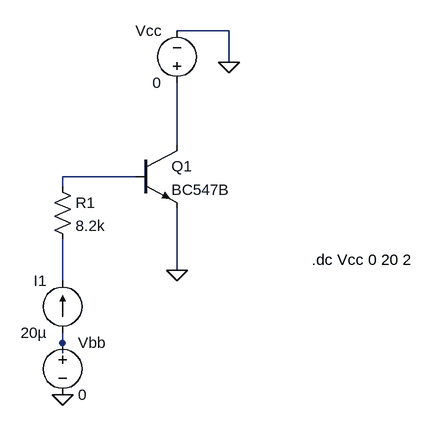
[diagram p0: schematic commonemitter.asc]
commonemitter.asc, the LTspice schematic file:
Version 4
SHEET 1 880 680
WIRE 160 -192 80 -192
WIRE 160 -144 160 -192
WIRE 80 -16 80 -112
WIRE 16 32 -96 32
WIRE -96 48 -96 32
WIRE 80 176 80 80
WIRE -96 192 -96 128
WIRE -96 288 -96 272
WIRE -96 304 -96 288
FLAG 80 176 0
FLAG 160 -144 0
FLAG -96 368 0
SYMBOL npn 16 -16 R0
SYMATTR InstName Q1
SYMATTR Value BC547B
SYMBOL res -112 32 R0
SYMATTR InstName R1
SYMATTR Value 8.2k
SYMBOL voltage 80 -96 R180
WINDOW 0 24 96 Left 2
WINDOW 3 24 16 Left 2
WINDOW 123 0 0 Left 0
WINDOW 39 0 0 Left 0
SYMATTR InstName Vcc
SYMATTR Value 0
SYMBOL current -96 272 R180
WINDOW 0 24 80 Left 2
WINDOW 3 24 0 Left 2
WINDOW 123 0 0 Left 0
WINDOW 39 0 0 Left 0
SYMATTR InstName I1
SYMATTR Value 20µ
SYMBOL voltage -96 272 R0
SYMATTR InstName Vbb
SYMATTR Value 0
TEXT 288 160 Left 2 !.dc Vcc 0 20 2

The netlist it stands for:
* commonemitter.asc
Q1 N001 N002 0 0 BC547B
R1 N002 N003 8.2k
Vcc N001 0 0
I1 N004 N003 20µ
Vbb N004 0 0
.model NPN NPN
.model PNP PNP
.lib standard.bjt
.dc Vcc 0 20 2
.backanno
.end